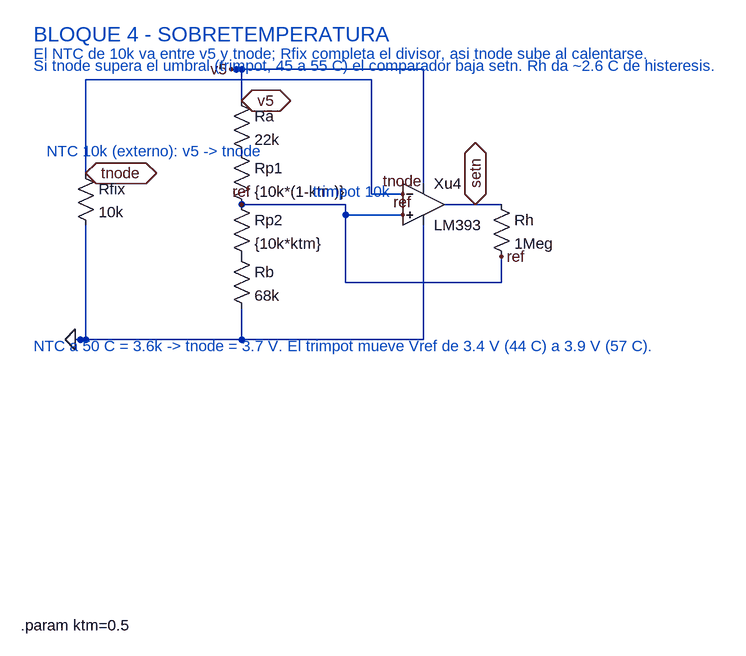
[diagram p0: schematic BLOQUE_TEMPERATURA.asc]
BLOQUE_TEMPERATURA.asc, the LTspice schematic file:
Version 4
SHEET 1 1000 700
WIRE 552 112 600 112
WIRE 600 112 640 112
WIRE 0 64 0 -80
WIRE 0 -80 440 -80
WIRE 440 -80 440 96
WIRE 440 96 488 96
WIRE 240 112 400 112
WIRE 400 112 400 128
WIRE 400 128 488 128
WIRE 640 192 640 232
WIRE 640 232 400 232
WIRE 400 232 400 128
WIRE 224 -96 520 -96
WIRE 224 -96 232 -96
WIRE 240 -48 240 -96
WIRE 520 80 520 -96
WIRE -16 320 520 320
WIRE -16 320 -8 320
WIRE 240 272 240 320
WIRE 0 144 0 320
WIRE 520 144 520 320
FLAG 0 64 tnode
FLAG 240 -48 v5
FLAG 240 112 ref
FLAG 488 128 ref
FLAG 488 96 tnode
FLAG 600 112 setn
FLAG 640 192 ref
FLAG 224 -96 v5
FLAG -16 320 0
IOPIN 0 64 BiDir
IOPIN 240 -48 BiDir
IOPIN 600 112 BiDir
SYMBOL res -16 48 R0
SYMATTR InstName Rfix
SYMATTR Value 10k
SYMBOL res 224 -64 R0
SYMATTR InstName Ra
SYMATTR Value 22k
SYMBOL res 224 16 R0
SYMATTR InstName Rp1
SYMATTR Value {10k*(1-ktm)}
SYMBOL res 224 96 R0
SYMATTR InstName Rp2
SYMATTR Value {10k*ktm}
SYMBOL res 224 176 R0
SYMATTR InstName Rb
SYMATTR Value 68k
SYMBOL OpAmps\opamp2 520 48 R0
SYMATTR InstName Xu4
SYMATTR Value LM393
SYMBOL res 624 96 R0
SYMATTR InstName Rh
SYMATTR Value 1Meg
TEXT -80 -150 Left 3 ;BLOQUE 4 - SOBRETEMPERATURA
TEXT -80 -120 Left 2 ;El NTC de 10k va entre v5 y tnode; Rfix completa el divisor, asi tnode sube al calentarse.
TEXT -80 -102 Left 2 ;Si tnode supera el umbral (trimpot, 45 a 55 C) el comparador baja setn. Rh da ~2.6 C de histeresis.
TEXT -60 30 Left 2 ;NTC 10k (externo): v5 -> tnode
TEXT 350 92 Left 2 ;trimpot 10k
TEXT -80 330 Left 2 ;NTC a 50 C = 3.6k -> tnode = 3.7 V. El trimpot mueve Vref de 3.4 V (44 C) a 3.9 V (57 C).
TEXT -100 760 Left 2 !.param ktm=0.5

The netlist it stands for:
* BLOQUE_TEMPERATURA.asc
Rfix tnode 0 10k
Ra v5 P001 22k
Rp1 P001 ref {10k*(1-ktm)}
Rp2 ref P002 {10k*ktm}
Rb P002 0 68k
XXu4 ref tnode v5 0 setn LM393  ; pins In+ In- V+ V- OUT
Rh setn ref 1Meg
* BLOQUE 4 - SOBRETEMPERATURA
* El NTC de 10k va entre v5 y tnode; Rfix completa el divisor, asi tnode sube al calentarse.
* Si tnode supera el umbral (trimpot, 45 a 55 C) el comparador baja setn. Rh da ~2.6 C de histeresis.
* NTC 10k (externo): v5 -> tnode
* trimpot 10k
* NTC a 50 C = 3.6k -> tnode = 3.7 V. El trimpot mueve Vref de 3.4 V (44 C) a 3.9 V (57 C).
.param ktm=0.5
.backanno
.end